# Altium schematic sheet P1.schdoc
size 297 x 209 mm; Symbol: Drawing-Symbol_A4; @Project Name: halfli; @Page Count: 1; @Update Date: 2026-10-10; @Create Date: 2026-10-10; @Schematic Name: Schematic1; @Page No: 1; @Page Name: P1; Company: EasyEDA.com; Version: V1.0; Page Size: A4; Device: Drawing-Symbol_A4; @Create Time: 09:25:46; @Update Time: 09:25:46; Border: 1; Width: 1170; Height: 825; Region Start: 1; X Region Count: 6; Y Region Count: 4; Blade Width: 10; Title Block Position: 3; @Board Name: Board1
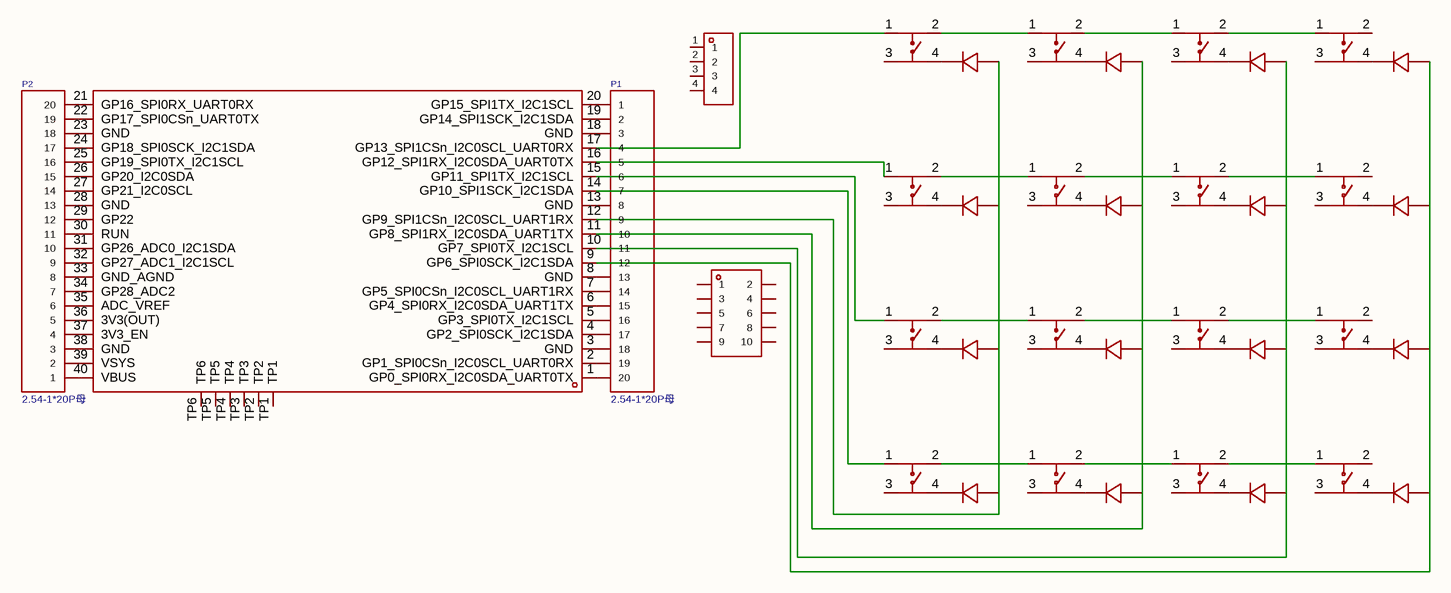
[diagram p0: P1.schdoc]

## Parts
D1  1N4148  [DO-35_BD2.0-L4.2-P8.20-D0.5-RD]  (value not drawn)
D2  1N4148  [DO-35_BD2.0-L4.2-P8.20-D0.5-RD]  (value not drawn)
D3  1N4148  [DO-35_BD2.0-L4.2-P8.20-D0.5-RD]  (value not drawn)
D4  1N4148  [DO-35_BD2.0-L4.2-P8.20-D0.5-RD]  (value not drawn)
D5  1N4148  [DO-35_BD2.0-L4.2-P8.20-D0.5-RD]  (value not drawn)
D6  1N4148  [DO-35_BD2.0-L4.2-P8.20-D0.5-RD]  (value not drawn)
D7  1N4148  [DO-35_BD2.0-L4.2-P8.20-D0.5-RD]  (value not drawn)
D8  1N4148  [DO-35_BD2.0-L4.2-P8.20-D0.5-RD]  (value not drawn)
D9  1N4148  [DO-35_BD2.0-L4.2-P8.20-D0.5-RD]  (value not drawn)
D10  1N4148  [DO-35_BD2.0-L4.2-P8.20-D0.5-RD]  (value not drawn)
D11  1N4148  [DO-35_BD2.0-L4.2-P8.20-D0.5-RD]  (value not drawn)
D12  1N4148  [DO-35_BD2.0-L4.2-P8.20-D0.5-RD]  (value not drawn)
D13  1N4148  [DO-35_BD2.0-L4.2-P8.20-D0.5-RD]  (value not drawn)
D14  1N4148  [DO-35_BD2.0-L4.2-P8.20-D0.5-RD]  (value not drawn)
D15  1N4148  [DO-35_BD2.0-L4.2-P8.20-D0.5-RD]  (value not drawn)
D16  1N4148  [DO-35_BD2.0-L4.2-P8.20-D0.5-RD]  (value not drawn)
H1  排母2.54mm2*5p 直  [HDR-TH_10P-P2.54-V-F-R2-C5-S2.54]  (value not drawn)
P1  2.54-1*20P母  [HDR-TH_20P-P2.54-V-F]
P2  2.54-1*20P母  [HDR-TH_20P-P2.54-V-F]
SW1  HX 3x4x2.5-PA-4N push button switch  [SW-SMD_4P-L4.2-W3.4-P2.15-LS5.2]  (value not drawn)
SW2  HX 3x4x2.5-PA-4N push button switch  [SW-SMD_4P-L4.2-W3.4-P2.15-LS5.2]  (value not drawn)
SW3  HX 3x4x2.5-PA-4N push button switch  [SW-SMD_4P-L4.2-W3.4-P2.15-LS5.2]  (value not drawn)
SW5  HX 3x4x2.5-PA-4N push button switch  [SW-SMD_4P-L4.2-W3.4-P2.15-LS5.2]  (value not drawn)
SW6  HX 3x4x2.5-PA-4N push button switch  [SW-SMD_4P-L4.2-W3.4-P2.15-LS5.2]  (value not drawn)
SW7  HX 3x4x2.5-PA-4N push button switch  [SW-SMD_4P-L4.2-W3.4-P2.15-LS5.2]  (value not drawn)
SW8  HX 3x4x2.5-PA-4N push button switch  [SW-SMD_4P-L4.2-W3.4-P2.15-LS5.2]  (value not drawn)
SW9  HX 3x4x2.5-PA-4N push button switch  [SW-SMD_4P-L4.2-W3.4-P2.15-LS5.2]  (value not drawn)
SW10  HX 3x4x2.5-PA-4N push button switch  [SW-SMD_4P-L4.2-W3.4-P2.15-LS5.2]  (value not drawn)
SW11  HX 3x4x2.5-PA-4N push button switch  [SW-SMD_4P-L4.2-W3.4-P2.15-LS5.2]  (value not drawn)
SW12  HX 3x4x2.5-PA-4N push button switch  [SW-SMD_4P-L4.2-W3.4-P2.15-LS5.2]  (value not drawn)
SW13  HX 3x4x2.5-PA-4N push button switch  [SW-SMD_4P-L4.2-W3.4-P2.15-LS5.2]  (value not drawn)
SW14  HX 3x4x2.5-PA-4N push button switch  [SW-SMD_4P-L4.2-W3.4-P2.15-LS5.2]  (value not drawn)
SW15  HX 3x4x2.5-PA-4N push button switch  [SW-SMD_4P-L4.2-W3.4-P2.15-LS5.2]  (value not drawn)
SW16  HX 3x4x2.5-PA-4N push button switch  [SW-SMD_4P-L4.2-W3.4-P2.15-LS5.2]  (value not drawn)
SW17  HX 3x4x2.5-PA-4N push button switch  [SW-SMD_4P-L4.2-W3.4-P2.15-LS5.2]  (value not drawn)
U1  Raspberry Pi Pico W  [COMM-SMD_L51.0-W21.0-P2.54_PICOW]  (value not drawn)
U2  DS1023-1*4S21  [HDR-TH_DS1023-1X4S21]  (value not drawn)

## Nets
NetD1_1: D1.1(C) SW14.4
NetD1_2: D1.2(A) D3.2(A) D15.2(A) D16.2(A) P1.9 U1.12(GP9_SPI1CSn_I2C0SCL_UART1RX)
NetD2_1: D2.1(C) SW13.4
NetD2_2: D2.2(A) D4.2(A) D13.2(A) D14.2(A) P1.10 U1.11(GP8_SPI1RX_I2C0SDA_UART1TX)
NetD3_1: D3.1(C) SW15.4
NetD4_1: D4.1(C) SW12.4
NetD5_1: D5.1(C) SW6.4
NetD5_2: D5.2(A) D6.2(A) D11.2(A) D12.2(A) P1.11 U1.10(GP7_SPI0TX_I2C1SCL)
NetD6_1: D6.1(C) SW7.4
NetD7_1: D7.1(C) SW3.4
NetD7_2: D7.2(A) D8.2(A) D9.2(A) D10.2(A) P1.12 U1.9(GP6_SPI0SCK_I2C1SDA)
NetD8_1: D8.1(C) SW2.4
NetD9_1: D9.1(C) SW9.4
NetD10_1: D10.1(C) SW8.4
NetD11_1: D11.1(C) SW16.4
NetD12_1: D12.1(C) SW10.4
NetD13_1: D13.1(C) SW1.4
NetD14_1: D14.1(C) SW17.4
NetD15_1: D15.1(C) SW5.4
NetD16_1: D16.1(C) SW11.4
NetP1_1: P1.1 U1.20(GP15_SPI1TX_I2C1SCL)
NetP1_2: P1.2 U1.19(GP14_SPI1SCK_I2C1SDA)
NetP1_3: P1.3 U1.18(GND)
NetP1_4: P1.4 SW14.1 U1.17(GP13_SPI1CSn_I2C0SCL_UART0RX)
NetP1_5: P1.5 SW15.1 U1.16(GP12_SPI1RX_I2C0SDA_UART0TX)
NetP1_6: P1.6 SW11.1 U1.15(GP11_SPI1TX_I2C1SCL)
NetP1_7: P1.7 SW5.1 U1.14(GP10_SPI1SCK_I2C1SDA)
NetP1_8: P1.8 U1.13(GND)
NetP1_13: P1.13 U1.8(GND)
NetP1_14: P1.14 U1.7(GP5_SPI0CSn_I2C0SCL_UART1RX)
NetP1_15: P1.15 U1.6(GP4_SPI0RX_I2C0SDA_UART1TX)
NetP1_16: P1.16 U1.5(GP3_SPI0TX_I2C1SCL)
NetP1_17: P1.17 U1.4(GP2_SPI0SCK_I2C1SDA)
NetP1_18: P1.18 U1.3(GND)
NetP1_19: P1.19 U1.2(GP1_SPI0CSn_I2C0SCL_UART0RX)
NetP1_20: P1.20 U1.1(GP0_SPI0RX_I2C0SDA_UART0TX)
NetP2_1: P2.1 U1.40(VBUS)
NetP2_2: P2.2 U1.39(VSYS)
NetP2_3: P2.3 U1.38(GND)
NetP2_4: P2.4 U1.37(3V3_EN)
NetP2_5: P2.5 U1.36(3V3(OUT))
NetP2_6: P2.6 U1.35(ADC_VREF)
NetP2_7: P2.7 U1.34(GP28_ADC2)
NetP2_8: P2.8 U1.33(GND_AGND)
NetP2_9: P2.9 U1.32(GP27_ADC1_I2C1SCL)
NetP2_10: P2.10 U1.31(GP26_ADC0_I2C1SDA)
NetP2_11: P2.11 U1.30(RUN)
NetP2_12: P2.12 U1.29(GP22)
NetP2_13: P2.13 U1.28(GND)
NetP2_14: P2.14 U1.27(GP21_I2C0SCL)
NetP2_15: P2.15 U1.26(GP20_I2C0SDA)
NetP2_16: P2.16 U1.25(GP19_SPI0TX_I2C1SCL)
NetP2_17: P2.17 U1.24(GP18_SPI0SCK_I2C1SDA)
NetP2_18: P2.18 U1.23(GND)
NetP2_19: P2.19 U1.22(GP17_SPI0CSn_UART0TX)
NetP2_20: P2.20 U1.21(GP16_SPI0RX_UART0RX)
NetSW1_1: SW1.1 SW11.2
NetSW1_2: SW1.2 SW10.1
NetSW2_1: SW2.1 SW7.2
NetSW3_1: SW3.1 SW6.2
NetSW5_2: SW5.2 SW17.1
NetSW6_1: SW6.1 SW13.2
NetSW7_1: SW7.1 SW12.2
NetSW8_1: SW8.1 SW16.2
NetSW9_1: SW9.1 SW10.2
NetSW12_1: SW12.1 SW15.2
NetSW13_1: SW13.1 SW14.2
NetSW16_1: SW16.1 SW17.2

Not connected (* = marked no-connect by the designer): H1 1 2 3 4 5 6 7 8 9 10; SW1 3; SW2 2 3; SW3 2 3; SW5 3; SW6 3; SW7 3; SW8 2 3; SW9 2 3; SW10 3; SW11 3; SW12 3; SW13 3; SW14 3; SW15 3; SW16 3; SW17 3; U1 TP1 TP2 TP3 TP4 TP5 TP6; U2 1 2 3 4

## Notes on the sheet
- Create at
- 2026-10-10
- Schematic
- Board
- Schematic1
- Board1
- Update at
- Page
- P1
- Drawn
- Reviewed
- halfli
- Version
- V1.0
- Size
- A4
- Page  1  Total  1
- EasyEDA.com

## Library data of the parts
D1-D16 = 1N4148_C402212: Diode Configuration:- Voltage - Forward(Vf@If):1V@10mA Voltage - DC Reverse(Vr):75V Current - Rectified:150mA Pd - Power Dissipation:500mW Reverse Leakage Current (Ir):5uA@75V Reverse Recovery Time (trr):4ns Operating Junction Temperature Range:- Operatin; Manufacturer: LGE(鲁光); AddInBom: yes; ModelId: 87807bcc1a9244ad8e6c1cd7667e28050819f05c4eef4c71ace90d822a990e87; ModelName: DO-35_D1.9-L3.9-P8.2; ModelTransform: 342.519,74.82103,0,0,0,0,-0.197,1.181,-137.795; Voltage - DC Reverse(Vr): 75V; Current - Rectified: 150mA; Pd - Power Dissipation: 500mW; Reverse Recovery Time (trr): 4ns; Non-Repetitive Peak Forward Surge Current: 2A; Symbol: 1N4148_C402212; Device: 1N4148_C402212; LCSC Part Name: 75V 150mA; SupplierPart: C402212; ManufacturerPart: 1N4148; Supplier Footprint: DO-35; JLCPCB Part Class: Extended Part; Datasheet: https://item.szlcsc.com/datasheet/1N4148/387357.html; Supplier: LCSC; ConvertToPcb: yes; FootprintName: DO-35_BD2.0-L4.2-P8.20-D0.5-RD; Diode Configuration: -; Voltage - Forward(Vf@If): 1V@10mA; Reverse Leakage Current (Ir): 5uA@75V; Operating Junction Temperature Range: -
H1 = 排母2.54mm2*5p 直: Pitch:2.54mm Row Spacing:2.54mm Circular Hole / Square Hole:Square Hole Mounting Type:Through Hole Number of Rows:2 Number of Positions:10P Holes Direction:Top Insulation Height:- Contact Material:Brass Contact Plating:-; Manufacturer: BOOMELE(博穆精密); Symbol: Female header2.54mm2*5p Straight; AddInBom: yes; ModelId: 8390fd2828104962a30919fe8f1c3f2f0819f05c4eef4c71ace90d822a990e87; ModelName: HDR2.54-F-LI-2X5P; ModelTransform: 499.999,200,0,0,0,0,0,0,-118.11; Pitch: 2.54mm; Number of Positions: 10P; Holes Direction: Top; Device: 排母2.54mm2*5p 直; Supplier Part: C30419; Supplier: LCSC; Manufacturer Part: 排母2.54mm2*5p 直; JLCPCB Part Class: Extended Part; LCSC Part Name: 间距:2.54mm 直插; Supplier Footprint: 插件,P=2.54mm; ConvertToPcb: yes; FootprintName: HDR-TH_10P-P2.54-V-F-R2-C5-S2.54; Row Spacing: 2.54mm; Circular Hole / Square Hole: Square Hole; Mounting Type: Through Hole; Number of Rows: 2; Insulation Height: -; Contact Material: Brass; Contact Plating: -
P1 P2 = 2.54-1*20P母: Holes Structure:1x20P Pitch:2.54mm Row Spacing:- Circular Hole / Square Hole:Square Hole Mounting Type:Through Hole Number of Rows:1 Number of Positions:20P Current Rating:3A Voltage Rating (Max):- Holes Direction:Top Insulation Height:- Contact Material:; Manufacturer: BOOMELE(博穆精密); Symbol: Header-Female-2.54_1x20; AddInBom: yes; ModelId: e3c555367c344e38993a8a537700b8580819f05c4eef4c71ace90d822a990e87; ModelName: HDR-F-2.54_1x20; ModelTransform: 1999.996,100,0,0,0,0,0,0,-118.11; Holes Structure: 1x20P; Pitch: 2.54mm; Number of Positions: 20P; Current Rating: 3A; Holes Direction: Top; PIN Length: 3.3mm; Device: 2.54-1*20P母; Supplier: LCSC; Manufacturer Part: 2.54-1*20P母; Supplier Part: C50984; JLCPCB Part Class: Extended Part; LCSC Part Name: 1x20P 间距:2.54mm 直插; Supplier Footprint: 插件,P=2.54mm; Datasheet: https://item.szlcsc.com/datasheet/2.54-1*20P%25E6%25AF%258D/51996.html; ConvertToPcb: yes; FootprintName: HDR-TH_20P-P2.54-V-F; Row Spacing: -; Circular Hole / Square Hole: Square Hole; Mounting Type: Through Hole; Number of Rows: 1; Voltage Rating (Max): -; Insulation Height: -; Contact Material: Brass; Contact Plating: Gold；Tin; Operating Temperature: -40℃~+105℃; Supplementary Features: -
SW1-SW3 SW5-SW17 = HX 3x4x2.5-PA-4N push button switch: Circuit:SPST Actuator Style:Round Button Operating Force:4N Mounting Type:Surface Mount,Vertical Length:4.2mm Width:3.35mm Switch Height:2.5mm with Bracket:Without Bracket Contact Current:50mA Voltage Rating:12V Actuator/Cap Color:Black With Lamp:No Termi; Manufacturer: hanxia(韩下); AddInBom: yes; ModelId: b7fa6c5ea8504faf8cab7e14705310650819f05c4eef4c71ace90d822a990e87; ModelName: SW-SMD_4P-L4.2-W3.4-H2.5-P2.15-LS5.2; ModelTransform: 204.724,133.858,0,0,0,0,0.002,0.002,0; Circuit: SPST; Operating Force: 4N; Switch Height: 2.5mm; Contact Current: 50mA; Voltage Rating: 12V; Actuator/Cap Color: Black; With Lamp: No; Life: 30,000 cycles; Symbol: HX 3X4X2.5-PA-4N PUSH BUTTON SWITCH; Device: HX 3x4x2.5-PA-4N push button switch; LCSC Part Name: 4.2*3.2*2.5mm 立贴平脚 4N; SupplierPart: C55200589; ManufacturerPart: HX 3x4x2.5-PA-4N push button switch; Supplier Footprint: SMD-4P,4.2x3.4mm; JLCPCB Part Class: Extended Part; Datasheet: https://item.szlcsc.com/datasheet/HX%25203x4x2.5-PA-4N%2520push%2520button%2520switch/59011496.html; Supplier: LCSC; ConvertToPcb: yes; FootprintName: SW-SMD_4P-L4.2-W3.4-P2.15-LS5.2; Actuator Style: Round Button; Mounting Type: Surface Mount,Vertical; Length: 4.2mm; Width: 3.35mm; with Bracket: Without Bracket; Termination Style: SMD(SMT) Tab; Operating Temperature: -40℃~+85℃
U1 = Raspberry Pi Pico W: Manufacturer: Raspberry Pi(树莓派); Symbol: PICO W; AddInBom: yes; ModelId: 381fa2bb3039480ba5b6f9190f0d53f10819f05c4eef4c71ace90d822a990e87; ModelTransform: 2059.051,826.77,0,0,0,0,-22.638,0,0; Device: Raspberry Pi Pico W; LCSC Part Name: SC0918; SupplierPart: C7203003; ManufacturerPart: Raspberry Pi Pico W; Supplier Footprint: -; JLCPCB Part Class: Extended Part; Datasheet: https://item.szlcsc.com/datasheet/Raspberry%2520Pi%2520Pico%2520W/8170961.html; Supplier: LCSC; ConvertToPcb: yes; FootprintName: COMM-SMD_L51.0-W21.0-P2.54_PICOW; ModelName: COMM-SMD_L51.0-W21.0-P2.54_PICOW
U2 = DS1023-1*4S21: Manufacturer: CONNFLY; AddInBom: yes; Symbol: DS1023-1*4S21; Device: DS1023-1*4S21; LCSC Part Name: DS1023-1*4S21; SupplierPart: C7423131; ManufacturerPart: DS1023-1*4S21; Supplier Footprint: 1x4THT2.54mm; JLCPCB Part Class: Extended Part; Datasheet: https://item.szlcsc.com/datasheet/DS1023-1*4S21/8407821.html; Supplier: LCSC; ConvertToPcb: yes; FootprintName: HDR-TH_DS1023-1X4S21